# Altium schematic sheet Sheet1.SchDoc
size A; SheetNumber: 2; SheetTotal: 2
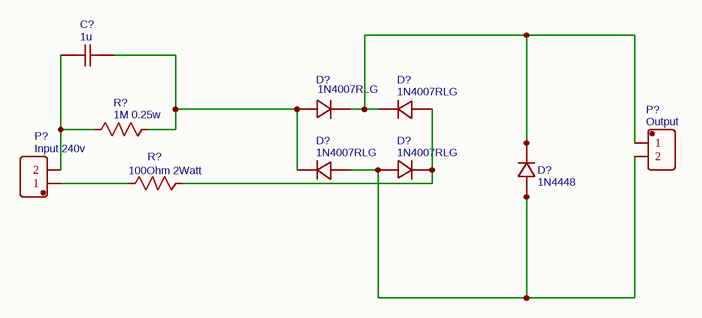
[diagram p0: Sheet1.SchDoc]

## Parts
(Parts that share a designator on the sheet are numbered #1, #2 ... from top to bottom, then left to right.)
C?  1u  [RAD-0.1]
D?#1  1N4007RLG  [DO-41]
D?#2  1N4007RLG  [DO-41]
D?#3  1N4007RLG  [DO-41]
D?#4  1N4007RLG  [DO-41]
D?#5  1N4448  [DO-35]
P?#1  Output  [WJ2EDGVC-5.08-2P]
P?#2  Input 240v  [WJ2EDGVC-5.08-2P]
R?#1  1M 0.25w  [AXIAL-0.3]
R?#2  100Ohm 2Watt  [AXIAL-0.3]

## Nets
NetC?_1: C?.1 D?#1.1(+) D?#3.2(-) R?#1.2
NetC?_2: C?.2 P?#2.2 R?#1.1
NetD?#1_2: D?#1.2(-) D?#2.2(-) D?#5.2(K) P?#1.1
NetD?#2_1: D?#2.1(+) D?#4.2(-) R?#2.2
NetD?#3_1: D?#3.1(+) D?#4.1(+) D?#5.1(A) P?#1.2
NetP?#2_1: P?#2.1 R?#2.1

## Library data of the parts
C? = 1u: nameAlias: Value(F); Manufacturer Part: ?; spicePre: C; spiceSymbolName: Cap_RAD-0.1_US
D?#1-D?#4 = 1N4007RLG: Manufacturer: ON; Supplier Part: C53568; Supplier: LCSC; Manufacturer Part: 1N4007RLG; image: //image.lceda.cn/szlcsc/C53568.jpg; spicePre: D
D?#5 = 1N4448: Manufacturer: SEMTECH; Supplier: LCSC; Manufacturer Part: 1N4448; image: //image.lceda.cn/szlcsc/C54037.jpg; Supplier Part: C54037; spicePre: D
P?#1 = Output: Manufacturer: ReliaPro; spicePre: X; Supplier: LCSC; Manufacturer Part: WJ2EDGVC-5.08-2P; image: //image.lceda.cn/szlcsc/C8445.jpg; Supplier Part: C8445
P?#2 = Input 240v: Manufacturer: ReliaPro; spicePre: X; Supplier Part: C8445; Supplier: LCSC; Manufacturer Part: WJ2EDGVC-5.08-2P; image: //image.lceda.cn/szlcsc/C8445.jpg
R?#1 = 1M 0.25w: nameAlias: Value(Ω); Manufacturer Part: ?; spicePre: R; spiceSymbolName: Res_AXIAL-0.3(1/8W)_US
R?#2 = 100Ohm 2Watt: nameAlias: Value(Ω); Manufacturer Part: ?; spicePre: R; spiceSymbolName: Res_AXIAL-0.3(1/8W)_US